# Altium schematic sheet Dock_Connector_Sheet.SchDoc
size A4; SheetNumber: 1; SheetTotal: 1
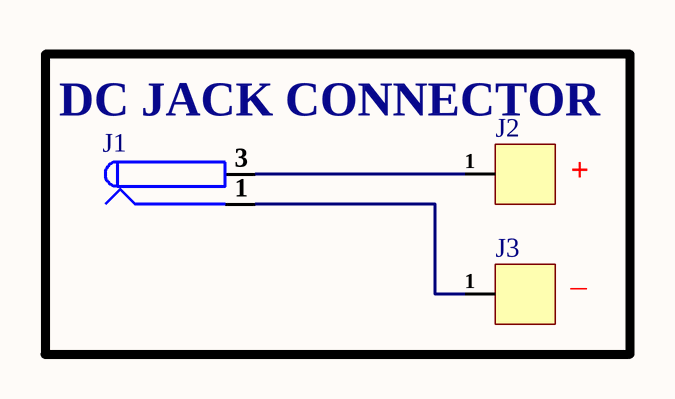
[diagram p0: Dock_Connector_Sheet.SchDoc]

## Parts
J1  CON-JACK_JACK-PLUG0  [CON-JACK_JACK-PLUG0]  (value not drawn)
J2  1P Through_Hole_Pad  [Through Hole 1 Pad]  (value not drawn)
J3  1P Through_Hole_Pad  [Through Hole 1 Pad]  (value not drawn)

## Blocks framed on the sheet
DC JACK CONNECTOR: J1-J3

## Nets
NetJ1_1: J1.1 J3.1
NetJ1_3: J1.3 J2.1

## Notes on the sheet
- (near J2) +
- _
- File:
- Title:
- Date:
- Page
- Num:
- Total:
- Drawn By: Huzaifa Ali

## Library data of the parts
J1 = CON-JACK_JACK-PLUG0: DC POWER JACK Power Jack, DC, Right Angle, Through Hole, Rated 5A at 16VDC, PC Terminals; Item Type: DC Jack
J2 J3 = 1P Through_Hole_Pad: Wire Connecting Pad